# Altium project SaleemD_Project.PrjPcb (part 3 of 3)

## Sheet Controller_Section.SchDoc
size A4; DocumentNumber: 4; SheetNumber: 4; SheetTotal: 6
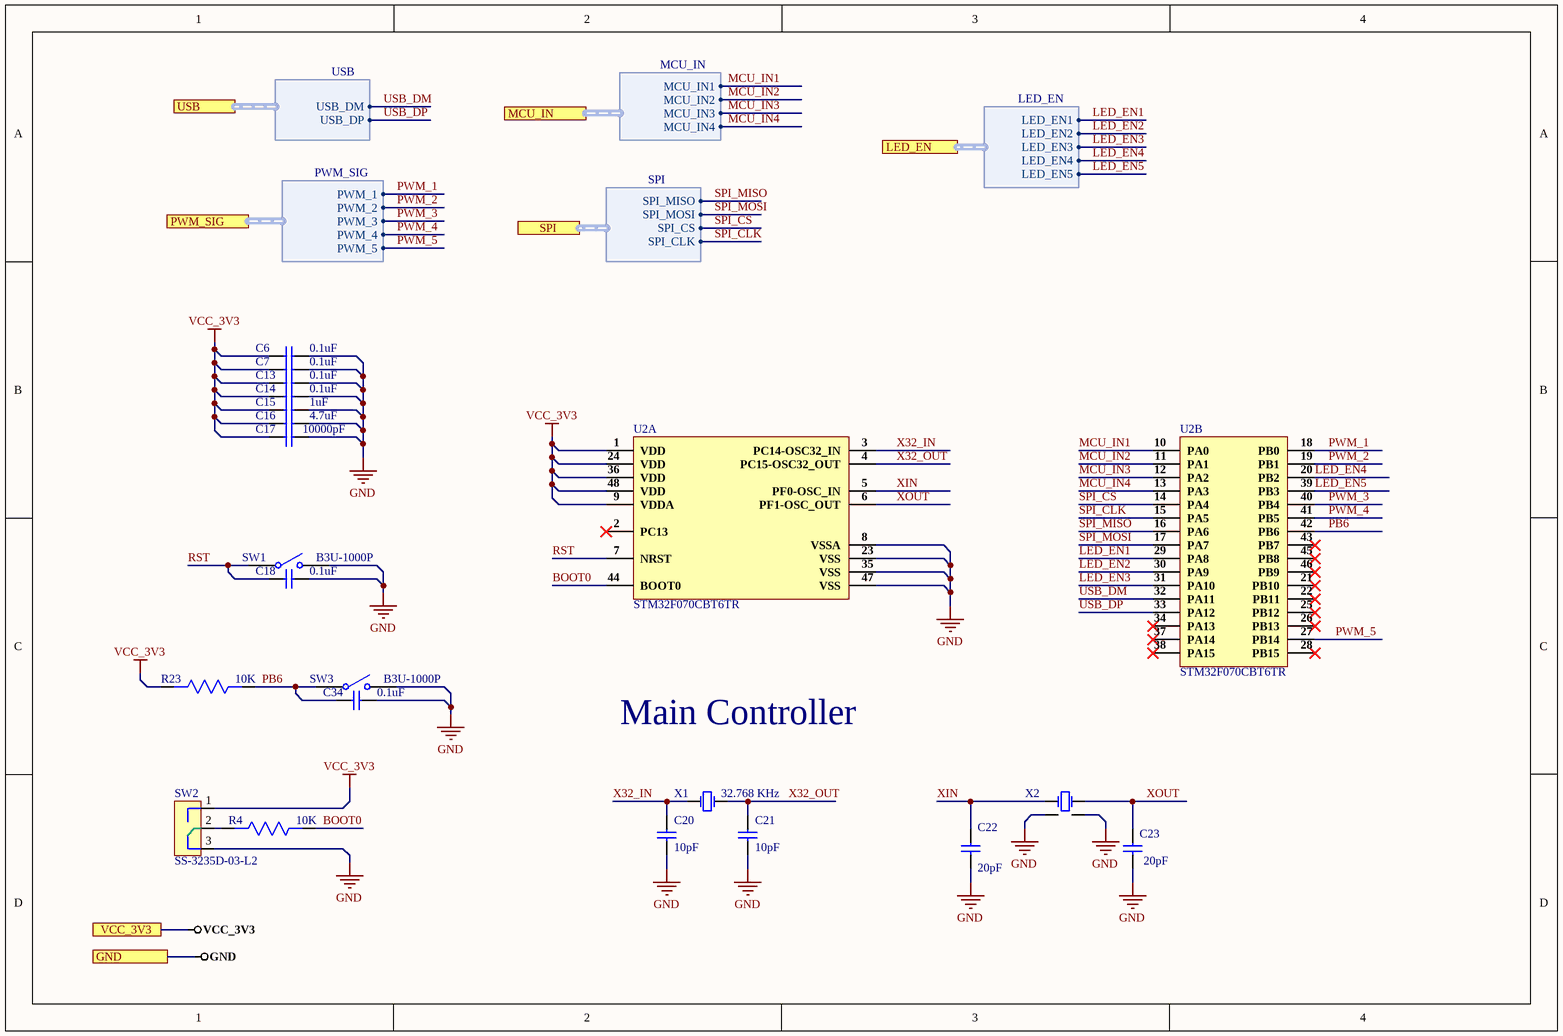
[diagram p4: Controller_Section.SchDoc]

### Parts
C6  0.1uF  [Cap0603]
C7  0.1uF  [Cap0603]
C13  0.1uF  [Cap0603]
C14  0.1uF  [Cap0603]
C15  1uF  [Cap0603]
C16  4.7uF  [Cap0603]
C17  10000pF  [Cap0603]
C18  0.1uF  [Cap0603]
C20  10pF  [Cap0603]
C21  10pF  [Cap0603]
C22  20pF  [Cap0603]
C23  20pF  [Cap0603]
C34  0.1uF  [Cap0603]
R4  10K  [Res0603]
R23  10K  [Res0603]
SW1  B3U-1000P  [B3U-1000P]
SW2  SS-3235D-03-L2  [SS-3235D-03-L2]
SW3  B3U-1000P  [B3U-1000P]
U2  STM32F070CBT6TR  [48-LQFP (7x7)]  (parts A,B of 2)
X1  32.768 KHz  [X1A000061002100]
X2  XXDCCLNANF-8.000000MHZ  [XXDCCLNANF-8.000000MHZ]  (value not drawn)

### Ports
GND, LED_EN (harness LED_EN), MCU_IN (harness MCU_IN), PWM_SIG (harness PWM_SIG), SPI (harness SPI), USB (harness USB), VCC_3V3

### Harnesses
PWM_SIG: PWM_1, PWM_2, PWM_3, PWM_4, PWM_5
SPI: SPI_MISO, SPI_CLK, SPI_CS, SPI_MOSI
MCU_IN: MCU_IN1, MCU_IN2, MCU_IN3, MCU_IN4
LED_EN: LED_EN1, LED_EN2, LED_EN3, LED_EN4, LED_EN5
USB: USB_DM, USB_DP

### Nets
GND: C6.2 C7.2 C13.2 C14.2 C15.2 C16.2 C17.2 C18.2 C20.1 C21.1 C22.1 C23.1 C34.2 SW1.2 SW2.3(+) SW3.2 U2.8(VSSA) U2.23(VSS) U2.35(VSS) U2.47(VSS) X2.2(GND) X2.4(GND) ; port GND
VCC_3V3: C6.1 C7.1 C13.1 C14.1 C15.1 C16.1 C17.1 R23.2 SW2.1(+) U2.1(VDD) U2.9(VDDA) U2.24(VDD) U2.36(VDD) U2.48(VDD) ; port VCC_3V3
BOOT0: R4.1 U2.44(BOOT0)
LED_EN1: U2.29(PA8) ; port LED_EN.LED_EN1
LED_EN2: U2.30(PA9) ; port LED_EN.LED_EN2
LED_EN3: U2.31(PA10) ; port LED_EN.LED_EN3
LED_EN4: U2.20(PB2) ; port LED_EN.LED_EN4
LED_EN5: U2.39(PB3) ; port LED_EN.LED_EN5
MCU_IN1: U2.10(PA0) ; port MCU_IN.MCU_IN1
MCU_IN2: U2.11(PA1) ; port MCU_IN.MCU_IN2
MCU_IN3: U2.12(PA2) ; port MCU_IN.MCU_IN3
MCU_IN4: U2.13(PA3) ; port MCU_IN.MCU_IN4
PB6: C34.1 R23.1 SW3.1 U2.42(PB6)
PWM_1: U2.18(PB0) ; port PWM_SIG.PWM_1
PWM_2: U2.19(PB1) ; port PWM_SIG.PWM_2
PWM_3: U2.40(PB4) ; port PWM_SIG.PWM_3
PWM_4: U2.41(PB5) ; port PWM_SIG.PWM_4
PWM_5: U2.27(PB14) ; port PWM_SIG.PWM_5
RST: C18.1 SW1.1 U2.7(NRST)
SPI_CLK: U2.15(PA5) ; port SPI.SPI_CLK
SPI_CS: U2.14(PA4) ; port SPI.SPI_CS
SPI_MISO: U2.16(PA6) ; port SPI.SPI_MISO
SPI_MOSI: U2.17(PA7) ; port SPI.SPI_MOSI
USB_DM: U2.32(PA11) ; port USB.USB_DM
USB_DP: U2.33(PA12) ; port USB.USB_DP
X32_IN: C20.2 U2.3(PC14-OSC32_IN) X1.1(OSC1)
X32_OUT: C21.2 U2.4(PC15-OSC32_OUT) X1.2(OSC2)
XIN: C22.2 U2.5(PF0-OSC_IN) X2.1(OSC1)
XOUT: C23.2 U2.6(PF1-OSC_OUT) X2.3(OSC2)
NetR4_2: R4.2 SW2.2(+)

Not connected (* = marked no-connect by the designer): U2 2(PC13)* 21(PB10)* 22(PB11)* 25(PB12)* 26(PB13)* 28(PB15)* 34(PA13)* 37(PA14)* 38(PA15)* 43(PB7)* 45(PB8)* 46(PB9)*

### Notes on the sheet
- Main Controller

### Library data of the parts
C6 C7 C13 C14 C18 C34 = CC0603KRX7R0BB104: CAP CER 0.1UF 100V X7R 0603; Manufacturer: Yageo; Capacitance: 100nF; Tolerance: 10%; Supplier 1: Digi-Key; Manufacturer Part Number: CC0603KRX7R0BB104; RoHS: Yes; Category: Ceramic Capacitors; Stock 1: 60476; Pricing 1: 1=0.19000, 10=0.13500, 50=0.07680, 100=0.06370, 500=0.04466, 1000=0.03696 (USD); Mount: Surface Mount; Case/Package: 0603; Case Code (Metric): 1608; Case Code (Imperial): 0603; Weight: 7.1E-05oz; Min Operating Temperature: -55°C; Max Operating Temperature: 125°C; Package Quantity: 4000; Voltage Rating: 100V; Packaging: Tape and Reel; Dielectric: X7R; Termination: SMD/SMT; Resistor Type: Ceramic; Voltage Rating (DC): 100V; Series: CC; Length: 0.063inch; Width: 0.031inch; Thickness: 0.035inch; Depth: 0.8mm; Lead Free: Lead Free; RoHS Compliant: Yes; ComponentLink1URL: https://datasheet.ciiva.com/6277/mlccorderingcode-6277030.pdf?src-supplier=Digi-Key; ComponentLink1Description: https://datasheet.ciiva.com/6277/mlccorderingcode-6277030.pdf?src-supplier=Digi-Key; ComponentLink2URL: https://datasheet.ciiva.com/6277/mlccorderingcode-6277081.pdf?src-supplier=Digi-Key; ComponentLink2Description: https://datasheet.ciiva.com/6277/mlccorderingcode-6277081.pdf?src-supplier=Digi-Key; ComponentLink3URL: https://datasheet.ciiva.com/6277/mlccorderingcode-6277082.pdf?src-supplier=Digi-Key; ComponentLink3Description: https://datasheet.ciiva.com/6277/mlccorderingcode-6277082.pdf?src-supplier=Digi-Key; Supplier Part Number 1: 311-1523-1-ND
C15 = CC0603KRX5R8BB105: CAP CER 1UF 25V X5R 0603; Manufacturer: Yageo; Tolerance: 10%; Supplier 1: Digi-Key; Manufacturer Part Number: CC0603KRX5R8BB105; Stock 1: 277068; Pricing 1: 1=0.13, 10=0.093, 100=0.0437, 500=0.03066, 1000=0.02539 (USD); Mount: Surface Mount; Case/Package: 0603; Number of Pins: 2; Case Code (Metric): 1608; Case Code (Imperial): 0603; Min Operating Temperature: -55°C; Max Operating Temperature: 85°C; Capacitance: 1uF; Dielectric: X5R; Package Quantity: 1; Voltage Rating: 25V; Packaging: Tape and Reel; Termination: SMD/SMT; Voltage Rating (DC): 25V; Length: 1.6mm; Height: 0.8mm; Width: 0.031inch; Thickness: 0.035inch; Depth: 0.8mm; Radiation Hardening: No; REACH SVHC: No SVHC; Lead Free: Lead Free; Halogen Free: Halogen Free; ComponentLink1URL: http://www.yageo.com/documents/recent/UPY-GPHC_X5R_4V-to-50V_25.pdf?src-supplier=Digi-Key; ComponentLink1Description: http://www.yageo.com/documents/recent/UPY-GPHC_X5R_4V-to-50V_25.pdf?src-supplier=Digi-Key; ComponentLink2URL: http://www.yageo.com/documents/recent/UPY-GPHC_X5R_4V-to-50V_12.pdf?src-supplier=Avnet+Europe; ComponentLink2Description: http://www.yageo.com/documents/recent/UPY-GPHC_X5R_4V-to-50V_12.pdf?src-supplier=Avnet+Europe; ComponentLink3URL: http://www.farnell.com/datasheets/1525783.pdf?src-supplier=Element14; ComponentLink3Description: http://www.farnell.com/datasheets/1525783.pdf?src-supplier=Element14; ComponentLink4URL: http://www.yageo.com/documents/recent/UPY-GPHC_X5R_4V-to-50V_12.pdf?src-supplier=Avnet; ComponentLink4Description: http://www.yageo.com/documents/recent/UPY-GPHC_X5R_4V-to-50V_12.pdf?src-supplier=Avnet; Supplier Part Number 1: 311-1445-6-ND
C16 = C1608X5R1E475KT000E: CAP CER, 4.7 µF, 25 V, 0603; Manufacturer: TDK; Dielectric Material: Ceramic; Tolerance: 10%; Voltage Rating: 25V; Dielectric: X5R; Supplier 1: Digi-Key; Manufacturer Part Number: C1608X5R1E475KT000E; RoHS: No; Supplier Part Number 1: 2220Y1000562GCT-ND; Supplier 2: RSComponents; Category: Ceramic Capacitors; Stock 2: 16120; Pricing 2: 100=0.23400, 200=0.21900, 1000=0.20700, 2000=0.18700 (GBP); Mount: Surface Mount; Case/Package: 0603; Weight: 7.1E-05oz; Case Code (Metric): 1608; Case Code (Imperial): 0603; Min Operating Temperature: -55°C; Max Operating Temperature: 85°C; Termination: SMD/SMT; Resistor Type: Ceramic; Packaging: Tape and Reel; Capacitance: 4.7uF; Package Quantity: 4000; Voltage Rating (DC): 25V; Length: 1.6mm; Width: 0.031inch; Height: 0.8mm; Thickness: 0.039inch; Depth: 0.8mm; Lead Free: Lead Free; REACH SVHC: No SVHC; ComponentLink1URL: https://datasheet.ciiva.com/48587/6print-detail-pdf-phplangenpart-noc1608x5r1e475k080acimp-unit-xmhz-48587141.pdf?src-supplier=Onlinecomponents.com; ComponentLink1Description: https://datasheet.ciiva.com/48587/6print-detail-pdf-phplangenpart-noc1608x5r1e475k080acimp-unit-xmhz-48587141.pdf?src-supplier=Onlinecomponents.com; ComponentLink2URL: https://datasheet.ciiva.com/24216/mlcc-commercial-general-en-24216326.pdf?src-supplier=Mouser; ComponentLink2Description: https://datasheet.ciiva.com/24216/mlcc-commercial-general-en-24216326.pdf?src-supplier=Mouser; ComponentLink3URL: https://datasheet.ciiva.com/48671/mlcc-commercial-general-en-48671304.pdf?src-supplier=Avnet; ComponentLink3Description: https://datasheet.ciiva.com/48671/mlcc-commercial-general-en-48671304.pdf?src-supplier=Avnet; Supplier Part Number 2: 9159158P
C17 = CC0603KRX7R9BB103: CAP CER 10000PF 50V X7R 0603; Manufacturer: Yageo; Material: Ceramic; Tolerance: 10%; Capacitance: 10nF; Insulation Resistance: 100GR; Supplier 1: Digi-Key; Manufacturer Part Number: CC0603KRX7R9BB103; Stock 1: 8411467; Pricing 1: 1=0.1, 10=0.038, 100=0.0171, 500=0.01224, 1000=0.00962 (USD); Mount: Surface Mount; Case/Package: 0603; Number of Pins: 2; Case Code (Metric): 1608; Case Code (Imperial): 0603; Min Operating Temperature: -55°C; Max Operating Temperature: 125°C; Dielectric: X7R; Voltage: 50V; Packaging: Tape and Reel; Voltage Rating: 50V; Voltage Rating (DC): 50V; Package Quantity: 1; Termination: SMD/SMT; Composition: Ceramic; Length: 1.6mm; Height: 0.8mm; Width: 0.031inch; Thickness: 0.035inch; Depth: 0.8mm; Radiation Hardening: No; REACH SVHC: No SVHC; Lead Free: Lead Free; Halogen Free: Halogen Free; ComponentLink1URL: http://www.farnell.com/datasheets/1734573.pdf?src-supplier=Element14; ComponentLink1Description: http://www.farnell.com/datasheets/1734573.pdf?src-supplier=Element14; ComponentLink2URL: http://www.yageo.com/documents/recent/UPY-GPHC_X7R_6.3V-to-50V_18.pdf?src-supplier=Digi-Key; ComponentLink2Description: http://www.yageo.com/documents/recent/UPY-GPHC_X7R_6.3V-to-50V_18.pdf?src-supplier=Digi-Key; ComponentLink3URL: http://www.farnell.com/datasheets/2167236.pdf?src-supplier=Mouser; ComponentLink3Description: http://www.farnell.com/datasheets/2167236.pdf?src-supplier=Mouser; ComponentLink4URL: http://www.farnell.com/datasheets/70765.pdf?src-supplier=Element14; ComponentLink4Description: http://www.farnell.com/datasheets/70765.pdf?src-supplier=Element14; ComponentLink5URL: http://www.yageo.com/documents/recent/UPY-GPHC_X7R_6.3V-to-50V_8.pdf?src-supplier=Avnet+Europe; ComponentLink5Description: http://www.yageo.com/documents/recent/UPY-GPHC_X7R_6.3V-to-50V_8.pdf?src-supplier=Avnet+Europe; ComponentLink6URL: http://www.farnell.com/datasheets/1489800.pdf?src-supplier=Element14; ComponentLink6Description: http://www.farnell.com/datasheets/1489800.pdf?src-supplier=Element14; ComponentLink7URL: https://www.verical.com/server-webapp/html/getDatasheet?partID=403582&src-supplier=Verical; ComponentLink7Description: https://www.verical.com/server-webapp/html/getDatasheet?partID=403582&src-supplier=Verical; Supplier Part Number 1: 311-1085-6-ND
C20 C21 = 06035A100JAT2A: CAP CER 10PF 50V C0G/NP0 0603; Manufacturer: Kyocera AVX; Manufacturer Part Number: 06035A100JAT2A/4K; Tolerance: 5%; Dielectric: C0G; Temperature Coefficient: 30ppm/°C; Insulation Resistance: 100GR; Supplier 1: Digi-Key; Stock 1: 196463; Pricing 1: 1=0.1, 10=0.05, 50=0.0272, 100=0.0222, 500=0.01586, 1000=0.01246 (USD); Mount: Surface Mount; Case/Package: 0603; Number of Pins: 2; Min Operating Temperature: -55°C; Max Operating Temperature: 125°C; Capacitance: 10pF; Packaging: Cut Tape; Voltage Rating (DC): 50V; Voltage: 50V; Length: 1.6mm; Width: 810um; Height: 0.9mm; Depth: 0.81mm; Thickness: 864um; REACH SVHC: No SVHC; Lead Free: Lead Free; Supplier Part Number 1: 478-1163-1-ND
C22 C23 = CL10C200JB8NNNC: CAP CER 20PF 50V C0G/NP0 0603; Manufacturer: Samsung; Tolerance: 5%; Dielectric: C0G; Temperature Coefficient: 300ppm/°C; Supplier 1: Digi-Key; Manufacturer Part Number: CL10C200JB8NNNC; Stock 1: 591193; Pricing 1: 1=0.1, 10=0.048, 100=0.0214, 500=0.0153, 1000=0.01202 (USD); Mount: Surface Mount; Case/Package: 0603; Case Code (Metric): 1608; Case Code (Imperial): 0603; Min Operating Temperature: -55°C; Max Operating Temperature: 125°C; Capacitance: 20pF; Package Quantity: 1; Packaging: Tape and Reel; Voltage Rating: 50V; Voltage: 50V; Length: 1.6mm; Height: 0.8mm; Width: 0.031inch; Thickness: 0.035inch; Depth: 0.8mm; Radiation Hardening: No; ComponentLink1URL: https://www.verical.com/server-webapp/html/getDatasheet?partID=640634&src-supplier=Verical; ComponentLink1Description: https://www.verical.com/server-webapp/html/getDatasheet?partID=640634&src-supplier=Verical; ComponentLink2URL: https://www.distrelec.biz/Web/Downloads/_e/ng/MLCC_CatalogDownload2013_ENG.pdf?mime=application%2Fpdf&src-supplier=Distrelec; ComponentLink2Description: https://www.distrelec.biz/Web/Downloads/_e/ng/MLCC_CatalogDownload2013_ENG.pdf?mime=application%2Fpdf&src-supplier=Distrelec; Supplier Part Number 1: 1276-1187-6-ND
R4 R23 = RC0603FR-0710KL: RES SMD 10K OHM 1% 1/10W 0603; Manufacturer: Yageo; Resistance: 10kR; Temperature Coefficient: 100ppm/°C; Voltage Rating (DC): 50V; Power Rating: 100mW; Voltage Rating: 75V; Supplier 1: Digi-Key; Manufacturer Part Number: RC0603FR-0710KL; Stock 1: 144725424; Pricing 1: 1=0.1, 10=0.024, 100=0.0097, 1000=0.00437, 2500=0.00379 (USD); Case/Package: 0603; Number of Pins: 2; Weight: 7.1E-05oz; Case Code (Imperial): 0603; Case Code (Metric): 1608; Min Operating Temperature: -55°C; Max Operating Temperature: 155°C; Tolerance: 1%; Composition: Thick Film; Packaging: Tape and Reel; Military Standard: Not; Termination: SMD/SMT; Length: 1.6mm; Height: 0.45mm; Width: 0.8mm; Depth: 0.8mm; Lead Pitch: 0.3mm; REACH SVHC: No SVHC; Lead Free: Lead Free; ComponentLink1URL: http://www.farnell.com/datasheets/38590.pdf?src-supplier=Element14; ComponentLink1Description: http://www.farnell.com/datasheets/38590.pdf?src-supplier=Element14; ComponentLink2URL: https://www.verical.com/server-webapp/html/getDatasheet?partID=409289&src-supplier=Verical; ComponentLink2Description: https://www.verical.com/server-webapp/html/getDatasheet?partID=409289&src-supplier=Verical; ComponentLink3URL: http://www.farnell.com/datasheets/1868787.pdf?src-supplier=Element14; ComponentLink3Description: http://www.farnell.com/datasheets/1868787.pdf?src-supplier=Element14; ComponentLink4URL: http://www.farnell.com/datasheets/2167052.pdf?src-supplier=Element14; ComponentLink4Description: http://www.farnell.com/datasheets/2167052.pdf?src-supplier=Element14; ComponentLink5URL: http://www.farnell.com/datasheets/443971.pdf?src-supplier=Element14; ComponentLink5Description: http://www.farnell.com/datasheets/443971.pdf?src-supplier=Element14; Supplier Part Number 1: 311-10.0KHRDKR-ND
SW1 SW3 = B3U-1000P: SWITCH TACTILE SPST-NO 0.05A 12V; Manufacturer: Omron; Mechanical Life: 200000Cycles; Operating Force: 1.5N; Throw Configuration: SPST; Current Rating: 50mA; Contact Resistance: 100mR; Illumination Type: Non-Illuminated,Illuminated; Switch Travel: 0.15mm; Switch Function: Off-Mom; Actuator Type: Standard; Actuator Length: 0.4mm; Ratings: Dust Proof,IP40; ComponentLink1URL: http://www.farnell.com/datasheets/60838.pdf?src-supplier=Farnell; ComponentLink1Description: http://www.farnell.com/datasheets/60838.pdf?src-supplier=Farnell; ComponentLink2URL: http://www.farnell.com/datasheets/60838.pdf?src-supplier=Element14; ComponentLink2Description: http://www.farnell.com/datasheets/60838.pdf?src-supplier=Element14; ComponentLink3URL: https://omronfs.omron.com/en_US/ecb/products/pdf/en-b3u.pdf?src-supplier=Digi-Key; ComponentLink3Description: https://omronfs.omron.com/en_US/ecb/products/pdf/en-b3u.pdf?src-supplier=Digi-Key; ComponentLink4URL: http://www.omron.com/ecb/products/pdf/en-b3u.pdf?src-supplier=Digi-Key; ComponentLink4Description: http://www.omron.com/ecb/products/pdf/en-b3u.pdf?src-supplier=Digi-Key; ComponentLink5URL: https://www.distrelec.biz/Web/Downloads/he/et/B3U_eng_datasheet.pdf?mime=application%2Fpdf&src-supplier=Distrelec; ComponentLink5Description: https://www.distrelec.biz/Web/Downloads/he/et/B3U_eng_datasheet.pdf?mime=application%2Fpdf&src-supplier=Distrelec; ComponentLink6URL: http://www.onlinecomponents.com/productFiles/mf-OM/en-b3u.pdf?src-supplier=Onlinecomponents.com; ComponentLink6Description: http://www.onlinecomponents.com/productFiles/mf-OM/en-b3u.pdf?src-supplier=Onlinecomponents.com; Supplier 1: Digi-Key; Manufacturer Part Number: B3U-1000P; Stock 1: 116454; Pricing 1: 1=1, 10=0.961, 25=0.9064, 50=0.7976, 100=0.7251, 250=0.68888, 500=0.67074, 1000=0.52571 (USD); Mount: Surface Mount; Weight: 0.000776oz; Contact Material: Silver; Min Operating Temperature: -25°C; Max Operating Temperature: 70°C; Packaging: Tape and Reel; Voltage Rating (DC): 12V; Package Quantity: 1; Max Current Rating: 50mA; Termination: SMD/SMT; Orientation: Straight; Max Voltage Rating (DC): 12V; Electrical Life: 200000Cycles; Insulation Resistance: 100MR; Contact Current Rating: 50mA; Length: 4mm; Height: 1.2mm; Depth: 2.5mm; Width: 3mm; REACH SVHC: Unknown; Lead Free: Lead Free; ComponentLink7URL: https://www.verical.com/server-webapp/html/getDatasheet?partID=552554&src-supplier=Verical; ComponentLink7Description: https://www.verical.com/server-webapp/html/getDatasheet?partID=552554&src-supplier=Verical; ComponentLink8URL: http://www.farnell.com/datasheets/1685550.pdf?src-supplier=Element14; ComponentLink8Description: http://www.farnell.com/datasheets/1685550.pdf?src-supplier=Element14; ComponentLink9URL: http://www.farnell.com/datasheets/2610940.pdf?src-supplier=Farnell; ComponentLink9Description: http://www.farnell.com/datasheets/2610940.pdf?src-supplier=Farnell; ComponentLink10URL: https://www.alliedelec.com/m/d/4c8a9ef82804fc3c241a13c1e298fd73.pdf?src-supplier=Allied+Electronics; ComponentLink10Description: https://www.alliedelec.com/m/d/4c8a9ef82804fc3c241a13c1e298fd73.pdf?src-supplier=Allied+Electronics; Supplier Part Number 1: SW1020DKR-ND
SW2 = SS-3235D-03-L2: SPDT 50mA @ 12VDC 12V On-On SMD Toggle Switches RoHS; Manufacturer: XKB Connectivity; Actuator Orientation: Vertical; Switch Height: 3mm; Actuator Type: Standard; Electrical Life Cycles: 10000; Operating Force: 200±100gf; Package: SMD; Circuit: SPDT; Contact Rating @ Voltage: 50mA @ 12VDC; Rated Voltage(DC): 12V; Mounting Type: Surface Mount; Contact Material: Brass; Contact Finish: Silver
U2 = STM32F070CBT6TR: Manufacturer: STMicroelectronics; Frequency: 48MHz; Interface: I2C,SPI,USB,UART,USART; Number of I/Os: 37; Oscillator Type: Internal; Memory Type: FLASH; Memory Size: 128KB; Peripherals: POR,PWM,WDT,DMA; Core Architecture: ARM; Supplier 1: Digi-Key; Manufacturer Part Number: STM32F070CBT6TR; RoHS: Yes; Category: Microcontrollers; Pricing 1: 1=3.40000, 10=3.05100, 25=2.87800, 100=2.45200, 250=2.30232, 500=2.01452, 1000=1.91860 (USD); Case/Package: LQFP; Min Operating Temperature: -40°C; Max Operating Temperature: 85°C; Packaging: Tape and Reel; Lead Free: Lead Free; RoHS Compliant: Yes; ComponentLink1URL: http://www.mouser.com/ds/2/389/stm32f070c6-956182.pdf?src-supplier=Mouser; ComponentLink1Description: http://www.mouser.com/ds/2/389/stm32f070c6-956182.pdf?src-supplier=Mouser; ComponentLink2URL: http://www.st.com/content/ccc/resource/technical/document/datasheet/31/4f/10/5f/a5/32/46/42/DM00141386.pdf/files/DM00141386.pdf/jcr:content/translations/en.DM00141386.pdf?src-supplier=Digi-Key; ComponentLink2Description: http://www.st.com/content/ccc/resource/technical/document/datasheet/31/4f/10/5f/a5/32/46/42/DM00141386.pdf/files/DM00141386.pdf/jcr:content/translations/en.DM00141386.pdf?src-supplier=Digi-Key; Supplier Part Number 1: 497-18745-6-ND
X1 = X1A000061002100: -40℃~85℃ 32768Hz 贴片无源晶振 ±20ppm 90kΩ 6pF SMD2012-2P Crystals ROHS; Manufacturer: Seiko Epson; Value: Custom; Manufacturer Part No: X1A000061002100; ComponentLink1Description: LCSC; ComponentLink1URL: https://www.lcsc.com/product-detail/Crystals_Seiko-Epson-X1A000061002100_C255767.html; Package: Custom
X2 = XXDCCLNANF-8.000000MHZ: 12pF -40℃~85℃ 贴片无源晶振 ±20ppm 8000000Hz SMD3225-4P Crystals ROHS; Manufacturer: TAITIEN Elec; Pakage: Custom; Manufacturer Part No: XXDCCLNANF-8.000000MHZ; Value: 8000000Hz; ComponentLink1Description: LCSC; ComponentLink1URL: https://www.lcsc.com/product-detail/Crystals_TAITIEN-Elec-XXDCCLNANF-8-000000MHZ_C521664.html

## Sheet LED_PWR_CTRL_Section.SchDoc
size A4; DocumentNumber: 3; SheetNumber: 3; SheetTotal: 6
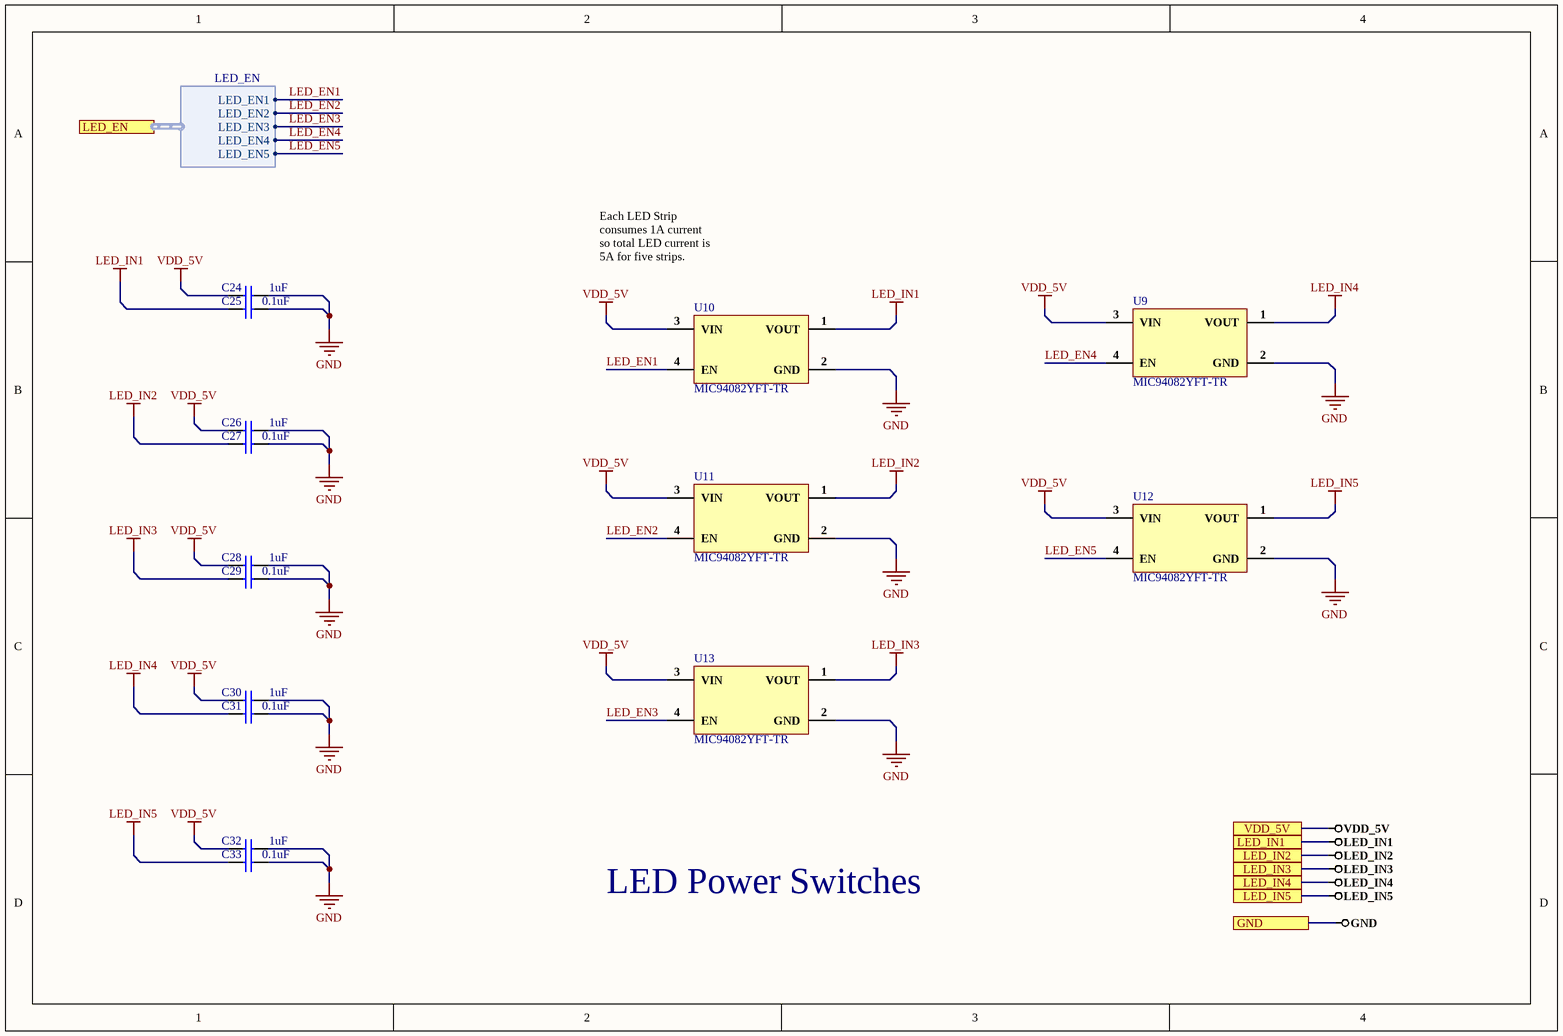
[diagram p5: LED_PWR_CTRL_Section.SchDoc]

### Parts
C24  1uF  [Cap0603]
C25  0.1uF  [Cap0603]
C26  1uF  [Cap0603]
C27  0.1uF  [Cap0603]
C28  1uF  [Cap0603]
C29  0.1uF  [Cap0603]
C30  1uF  [Cap0603]
C31  0.1uF  [Cap0603]
C32  1uF  [Cap0603]
C33  0.1uF  [Cap0603]
U9  MIC94082YFT-TR  [MIC94082YFT-TR]
U10  MIC94082YFT-TR  [MIC94082YFT-TR]
U11  MIC94082YFT-TR  [MIC94082YFT-TR]
U12  MIC94082YFT-TR  [MIC94082YFT-TR]
U13  MIC94082YFT-TR  [MIC94082YFT-TR]

### Ports
GND, LED_EN (harness LED_EN), LED_IN1, LED_IN2, LED_IN3, LED_IN4, LED_IN5, VDD_5V

### Harnesses
LED_EN: LED_EN1, LED_EN2, LED_EN3, LED_EN4, LED_EN5

### Nets
GND: C24.2 C25.2 C26.2 C27.2 C28.2 C29.2 C30.2 C31.2 C32.2 C33.2 U9.2(GND) U10.2(GND) U11.2(GND) U12.2(GND) U13.2(GND) ; port GND
LED_IN1: C25.1 U10.1(VOUT) ; port LED_IN1
LED_IN2: C27.1 U11.1(VOUT) ; port LED_IN2
LED_IN3: C29.1 U13.1(VOUT) ; port LED_IN3
LED_IN4: C31.1 U9.1(VOUT) ; port LED_IN4
LED_IN5: C33.1 U12.1(VOUT) ; port LED_IN5
VDD_5V: C24.1 C26.1 C28.1 C30.1 C32.1 U9.3(VIN) U10.3(VIN) U11.3(VIN) U12.3(VIN) U13.3(VIN) ; port VDD_5V
LED_EN1: U10.4(EN) ; port LED_EN.LED_EN1
LED_EN2: U11.4(EN) ; port LED_EN.LED_EN2
LED_EN3: U13.4(EN) ; port LED_EN.LED_EN3
LED_EN4: U9.4(EN) ; port LED_EN.LED_EN4
LED_EN5: U12.4(EN) ; port LED_EN.LED_EN5

### Notes on the sheet
- Each LED Strip consumes 1A current so total LED current is 5A for five strips.
- LED Power Switches

### Library data of the parts
C24 C26 C28 C30 C32 = CC0603KRX5R8BB105: as C15 on sheet Controller_Section; Supplier 1: Digi-Key; Manufacturer Part Number: CC0603KRX5R8BB105; Stock 1: 277068; Pricing 1: 1=0.13, 10=0.093, 100=0.0437, 500=0.03066, 1000=0.02539 (USD); Mount: Surface Mount; Case/Package: 0603; Number of Pins: 2; Case Code (Metric): 1608; Case Code (Imperial): 0603; Min Operating Temperature: -55°C; Max Operating Temperature: 85°C; Capacitance: 1uF; Dielectric: X5R; Package Quantity: 1; Voltage Rating: 25V; Packaging: Tape and Reel; Termination: SMD/SMT; Voltage Rating (DC): 25V; Length: 1.6mm; Height: 0.8mm; Width: 0.031inch; Thickness: 0.035inch; Depth: 0.8mm; Radiation Hardening: No; REACH SVHC: No SVHC; Lead Free: Lead Free; Halogen Free: Halogen Free; ComponentLink1URL: http://www.yageo.com/documents/recent/UPY-GPHC_X5R_4V-to-50V_25.pdf?src-supplier=Digi-Key; ComponentLink1Description: http://www.yageo.com/documents/recent/UPY-GPHC_X5R_4V-to-50V_25.pdf?src-supplier=Digi-Key; ComponentLink2URL: http://www.yageo.com/documents/recent/UPY-GPHC_X5R_4V-to-50V_12.pdf?src-supplier=Avnet+Europe; ComponentLink2Description: http://www.yageo.com/documents/recent/UPY-GPHC_X5R_4V-to-50V_12.pdf?src-supplier=Avnet+Europe; ComponentLink3URL: http://www.farnell.com/datasheets/1525783.pdf?src-supplier=Element14; ComponentLink3Description: http://www.farnell.com/datasheets/1525783.pdf?src-supplier=Element14; ComponentLink4URL: http://www.yageo.com/documents/recent/UPY-GPHC_X5R_4V-to-50V_12.pdf?src-supplier=Avnet; ComponentLink4Description: http://www.yageo.com/documents/recent/UPY-GPHC_X5R_4V-to-50V_12.pdf?src-supplier=Avnet; Supplier Part Number 1: 311-1445-6-ND
C25 C27 C29 C31 C33 = CC0603KRX7R0BB104: as C6 on sheet Controller_Section; Supplier 1: Digi-Key; Manufacturer Part Number: CC0603KRX7R0BB104; RoHS: Yes; Category: Ceramic Capacitors; Stock 1: 60476; Pricing 1: 1=0.19000, 10=0.13500, 50=0.07680, 100=0.06370, 500=0.04466, 1000=0.03696 (USD); Mount: Surface Mount; Case/Package: 0603; Case Code (Metric): 1608; Case Code (Imperial): 0603; Weight: 7.1E-05oz; Min Operating Temperature: -55°C; Max Operating Temperature: 125°C; Package Quantity: 4000; Voltage Rating: 100V; Packaging: Tape and Reel; Dielectric: X7R; Termination: SMD/SMT; Resistor Type: Ceramic; Voltage Rating (DC): 100V; Series: CC; Length: 0.063inch; Width: 0.031inch; Thickness: 0.035inch; Depth: 0.8mm; Lead Free: Lead Free; RoHS Compliant: Yes; ComponentLink1URL: https://datasheet.ciiva.com/6277/mlccorderingcode-6277030.pdf?src-supplier=Digi-Key; ComponentLink1Description: https://datasheet.ciiva.com/6277/mlccorderingcode-6277030.pdf?src-supplier=Digi-Key; ComponentLink2URL: https://datasheet.ciiva.com/6277/mlccorderingcode-6277081.pdf?src-supplier=Digi-Key; ComponentLink2Description: https://datasheet.ciiva.com/6277/mlccorderingcode-6277081.pdf?src-supplier=Digi-Key; ComponentLink3URL: https://datasheet.ciiva.com/6277/mlccorderingcode-6277082.pdf?src-supplier=Digi-Key; ComponentLink3Description: https://datasheet.ciiva.com/6277/mlccorderingcode-6277082.pdf?src-supplier=Digi-Key; Supplier Part Number 1: 311-1523-1-ND
U9-U13 = MIC94082YFT-TR: Power Switch Hi Side 2A 4-Pin Thin MLF T/R; Manufacturer: Microchip; Manufacturer Part Number: MIC94082YFTTR; Number of Outputs: 1; Min Supply Voltage: 1.7V; Max Supply Voltage: 5.5V; Interface: On/Off; Turn-Off Delay Time: 200ns; On-State Resistance: 67mR; Turn-On Delay Time: 1.5us; Output Configuration: High Side; Supplier 1: Digi-Key; RoHS: Yes; Category: Hot Swap Controllers; Mount: Surface Mount; Number of Pins: 4; Min Operating Temperature: -40°C; Max Operating Temperature: 125°C; Nominal Supply Current: 2A; Output Current: 2A; Packaging: Tape and Reel; Package Quantity: 5000; Current Rating: 2A; Max Output Current: 2A; Series: -; Supply Current: 2A; Rated Current-Max: 2A; On-state Resistance-Max: 67MR; Radiation Hardening: No; REACH SVHC: No SVHC; Lead Free: Lead Free; RoHS Compliant: Yes; ComponentLink1URL: https://datasheet.ciiva.com/1955/mic94080-5-1955731.pdf?src-supplier=Digi-Key; ComponentLink1Description: https://datasheet.ciiva.com/1955/mic94080-5-1955731.pdf?src-supplier=Digi-Key; ComponentLink2URL: https://datasheet.ciiva.com/1955/mic94080-5-1955730.pdf?src-supplier=Digi-Key; ComponentLink2Description: https://datasheet.ciiva.com/1955/mic94080-5-1955730.pdf?src-supplier=Digi-Key; ComponentLink3URL: https://datasheet.ciiva.com/1955/mic94080-5-1955732.pdf?src-supplier=Digi-Key; ComponentLink3Description: https://datasheet.ciiva.com/1955/mic94080-5-1955732.pdf?src-supplier=Digi-Key; ComponentLink4URL: https://datasheet.ciiva.com/16466/mic94080-5-16466430.pdf?src-supplier=Future+Electronics; ComponentLink4Description: https://datasheet.ciiva.com/16466/mic94080-5-16466430.pdf?src-supplier=Future+Electronics; ComponentLink5URL: https://datasheet.ciiva.com/26948/getdatasheetpartid-792432-26948156.pdf?src-supplier=Verical; ComponentLink5Description: https://datasheet.ciiva.com/26948/getdatasheetpartid-792432-26948156.pdf?src-supplier=Verical; Supplier Part Number 1: 576-3342-1-ND

## Nets that join several sheets
GND: Connector_Section (27 pins), Power_Section (13 pins), Opto_Section (12 pins), Controller_Section (22 pins), LED_PWR_CTRL_Section (15 pins)
LED_IN1: Connector_Section (J1.1), LED_PWR_CTRL_Section (C25.1 U10.1)
LED_IN2: Connector_Section (J2.1), LED_PWR_CTRL_Section (C27.1 U11.1)
LED_IN3: Connector_Section (J4.1), LED_PWR_CTRL_Section (C29.1 U13.1)
LED_IN4: Connector_Section (J5.1), LED_PWR_CTRL_Section (C31.1 U9.1)
LED_IN5: Connector_Section (J7.1), LED_PWR_CTRL_Section (C33.1 U12.1)
VBAT: Connector_Section (D5.4 D6.4), Power_Section (5 pins)
VCC_3V3: Connector_Section (6 pins), Power_Section (C9.1 U3.2), Opto_Section (R8.2 R9.2 R10.2 R11.2), Controller_Section (14 pins)
VDD_5V: Connector_Section (C12.1 U8.23 U8.24), Power_Section (5 pins), LED_PWR_CTRL_Section (10 pins)
BUTTON_1: Connector_Section (D5.3 J3.1), Opto_Section (R7.2)
BUTTON_2: Connector_Section (D5.1 J3.2), Opto_Section (R12.2)
BUTTON_3: Connector_Section (D6.3 J3.3), Opto_Section (R13.2)
BUTTON_4: Connector_Section (D6.1 J3.4), Opto_Section (R14.2)
LED_EN1: Controller_Section (U2.29), LED_PWR_CTRL_Section (U10.4)
LED_EN2: Controller_Section (U2.30), LED_PWR_CTRL_Section (U11.4)
LED_EN3: Controller_Section (U2.31), LED_PWR_CTRL_Section (U13.4)
LED_EN4: Controller_Section (U2.20), LED_PWR_CTRL_Section (U9.4)
LED_EN5: Controller_Section (U2.39), LED_PWR_CTRL_Section (U12.4)
MCU_IN1: Opto_Section (R8.1 U4.4), Controller_Section (U2.10)
MCU_IN2: Opto_Section (R9.1 U5.4), Controller_Section (U2.11)
MCU_IN3: Opto_Section (R10.1 U6.4), Controller_Section (U2.12)
MCU_IN4: Opto_Section (R11.1 U7.4), Controller_Section (U2.13)
PWM_1: Connector_Section (U8.3), Controller_Section (U2.18)
PWM_2: Connector_Section (U8.4), Controller_Section (U2.19)
PWM_3: Connector_Section (U8.5), Controller_Section (U2.40)
PWM_4: Connector_Section (U8.6), Controller_Section (U2.41)
PWM_5: Connector_Section (U8.7), Controller_Section (U2.27)
SPI_CLK: Connector_Section (J6.5), Controller_Section (U2.15)
SPI_CS: Connector_Section (J6.2), Controller_Section (U2.14)
SPI_MISO: Connector_Section (J6.7), Controller_Section (U2.16)
SPI_MOSI: Connector_Section (J6.3), Controller_Section (U2.17)
USB_DM: Connector_Section (J8.2), Controller_Section (U2.32)
USB_DP: Connector_Section (J8.3 R22.1), Controller_Section (U2.33)